# Altium schematic sheet Phase Current_Voltage Sense.SchDoc: =DT_SCH_Title
size A3; Organization: Droid Technologies; SheetNumber: 10; SheetTotal: 15
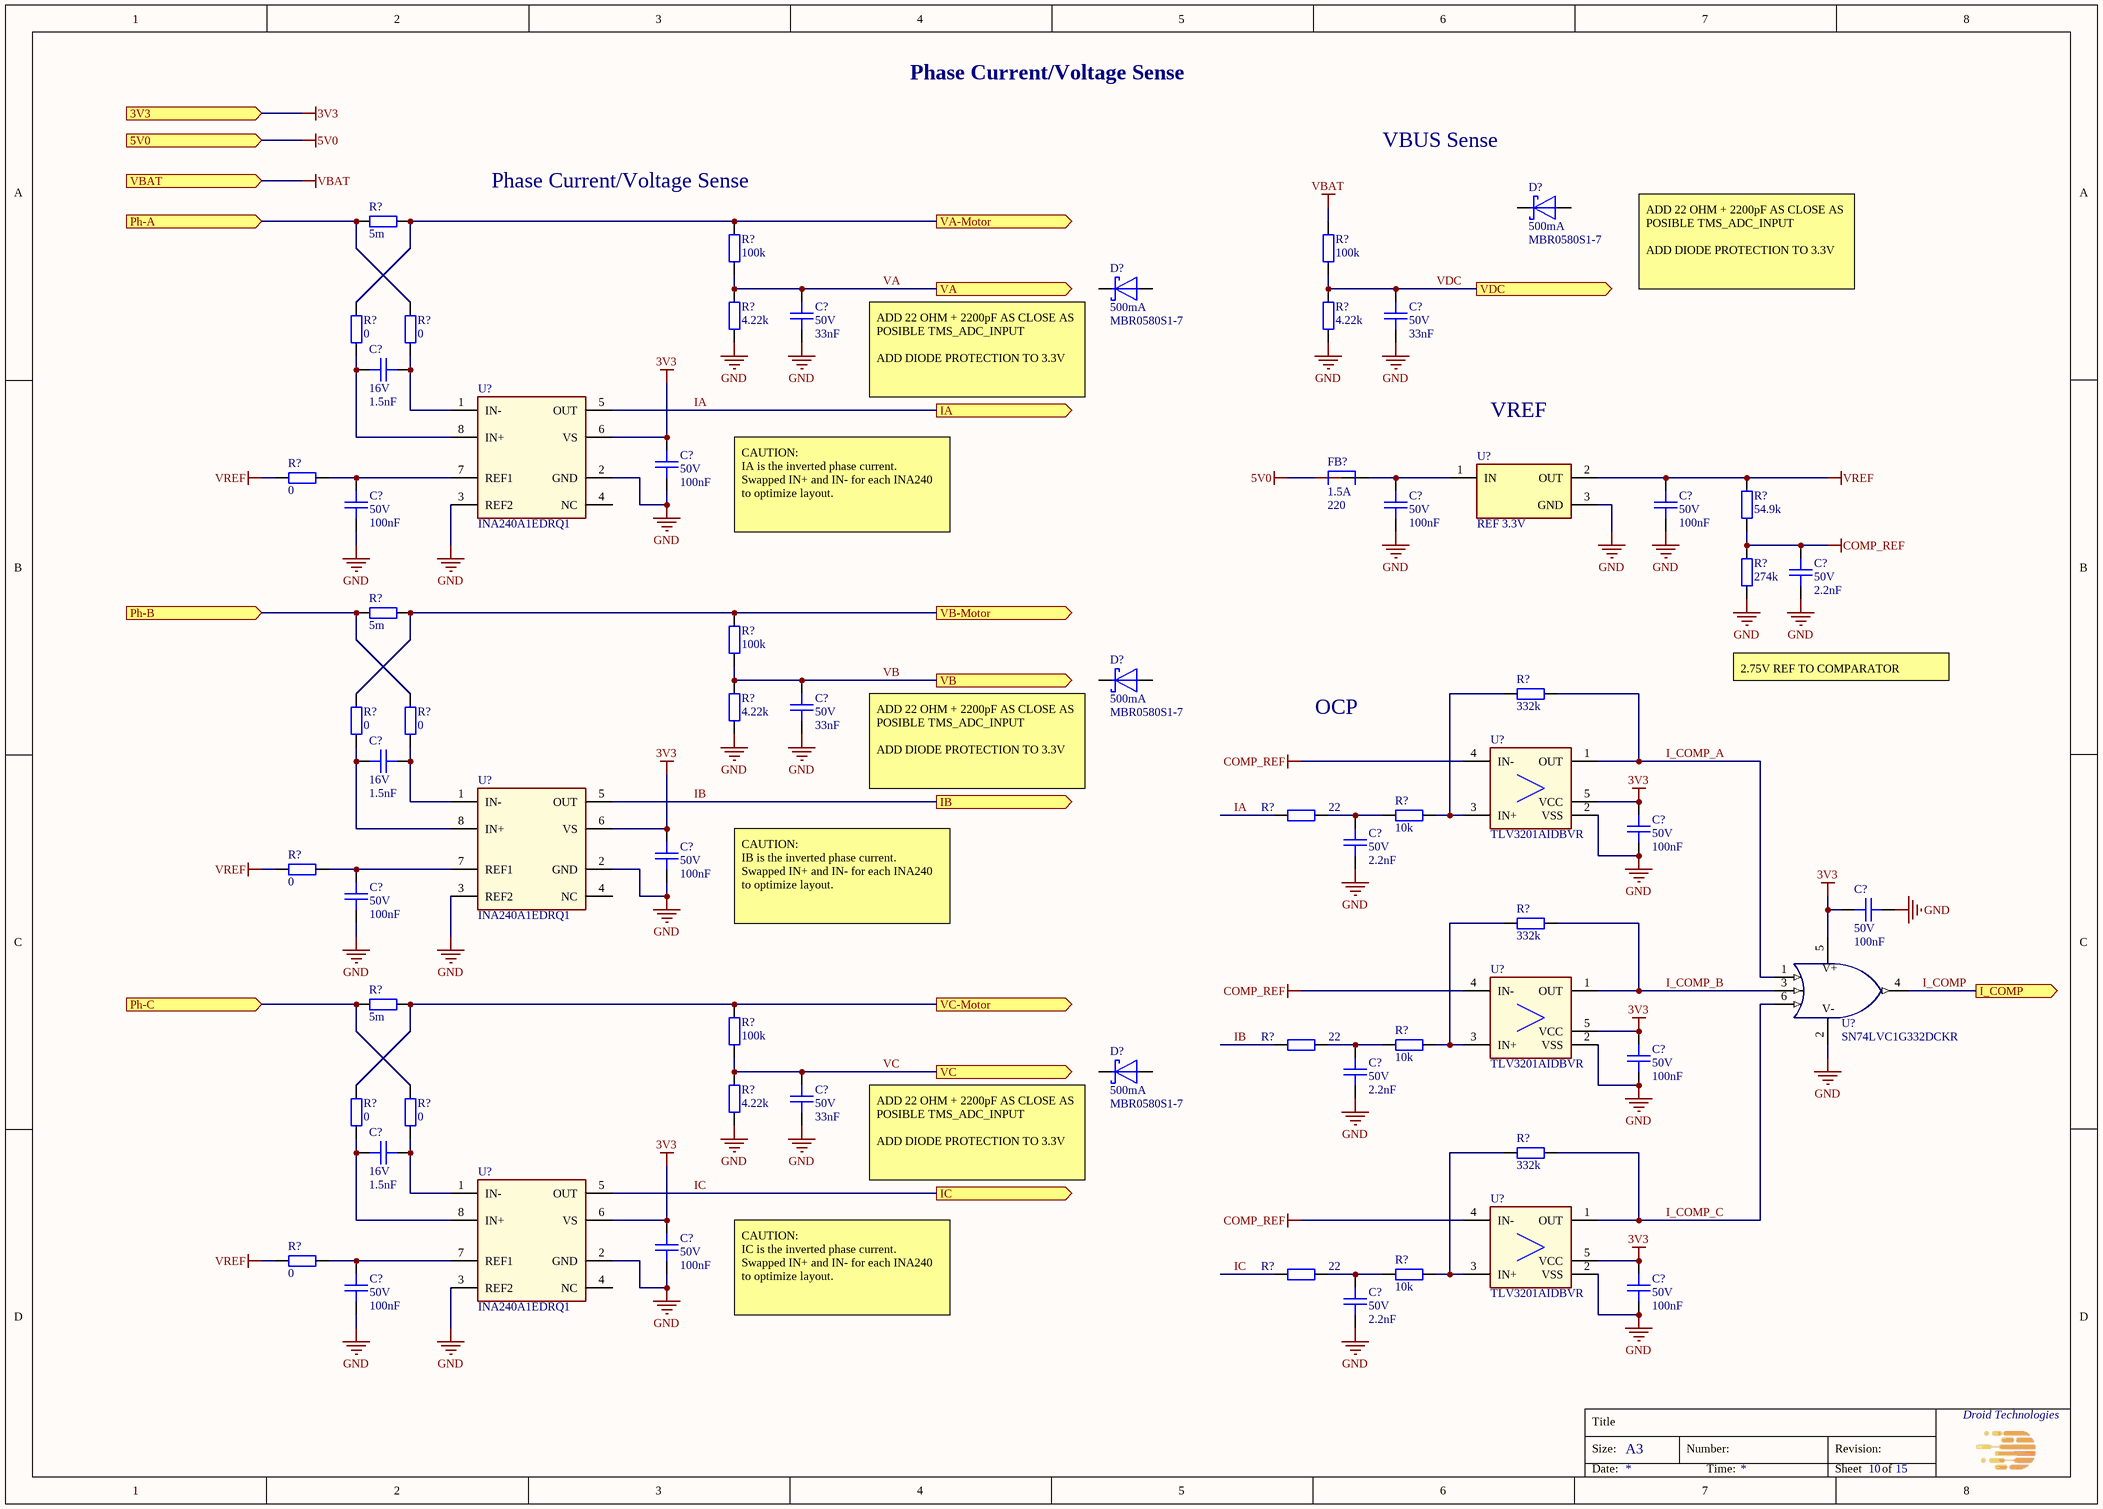
[diagram p0: Phase Current_Voltage Sense.SchDoc]

## Parts
(Parts that share a designator on the sheet are numbered #1, #2 ... from top to bottom, then left to right.)
C?#1  Voltage Rating: 50V  Capacitance: 33nF  [CAPC100x50x50L25]  (hidden comment: GCM155L8EH333KE07D)
C?#2  Voltage Rating: 50V  Capacitance: 33nF  [CAPC100x50x50L25]  (hidden comment: GCM155L8EH333KE07D)
C?#3  Voltage Rating: 16V  Capacitance: 1.5nF  [CAPC100x50x50L25]  (hidden comment: C0402C152F4HACAUTO)
C?#4  Voltage Rating: 50V  Capacitance: 100nF  [CAPC100x50x50L25]  (hidden comment: GCM155L8EH104KE07D)
C?#5  Voltage Rating: 50V  Capacitance: 100nF  [CAPC100x50x50L25]  (hidden comment: GCM155L8EH104KE07D)
C?#6  Voltage Rating: 50V  Capacitance: 100nF  [CAPC100x50x50L25]  (hidden comment: GCM155L8EH104KE07D)
C?#7  Voltage Rating: 50V  Capacitance: 100nF  [CAPC100x50x50L25]  (hidden comment: GCM155L8EH104KE07D)
C?#8  Voltage Rating: 50V  Capacitance: 2.2nF  [CAPC100x50x50L25]  (hidden comment: CGA2B2X8R1H222K050BA)
C?#9  Voltage Rating: 50V  Capacitance: 33nF  [CAPC100x50x50L25]  (hidden comment: GCM155L8EH333KE07D)
C?#10  Voltage Rating: 16V  Capacitance: 1.5nF  [CAPC100x50x50L25]  (hidden comment: C0402C152F4HACAUTO)
C?#11  Voltage Rating: 50V  Capacitance: 100nF  [CAPC100x50x50L25]  (hidden comment: GCM155L8EH104KE07D)
C?#12  Voltage Rating: 50V  Capacitance: 2.2nF  [CAPC100x50x50L25]  (hidden comment: CGA2B2X8R1H222K050BA)
C?#13  Voltage Rating: 50V  Capacitance: 100nF  [CAPC100x50x50L25]  (hidden comment: GCM155L8EH104KE07D)
C?#14  Voltage Rating: 50V  Capacitance: 100nF  [CAPC100x50x50L25]  (hidden comment: GCM155L8EH104KE07D)
C?#15  Voltage Rating: 50V  Capacitance: 100nF  [CAPC100x50x50L25]  (hidden comment: GCM155L8EH104KE07D)
C?#16  Voltage Rating: 50V  Capacitance: 100nF  [CAPC100x50x50L25]  (hidden comment: GCM155L8EH104KE07D)
C?#17  Voltage Rating: 50V  Capacitance: 2.2nF  [CAPC100x50x50L25]  (hidden comment: CGA2B2X8R1H222K050BA)
C?#18  Voltage Rating: 50V  Capacitance: 33nF  [CAPC100x50x50L25]  (hidden comment: GCM155L8EH333KE07D)
C?#19  Voltage Rating: 16V  Capacitance: 1.5nF  [CAPC100x50x50L25]  (hidden comment: C0402C152F4HACAUTO)
C?#20  Voltage Rating: 50V  Capacitance: 100nF  [CAPC100x50x50L25]  (hidden comment: GCM155L8EH104KE07D)
C?#21  Voltage Rating: 50V  Capacitance: 100nF  [CAPC100x50x50L25]  (hidden comment: GCM155L8EH104KE07D)
C?#22  Voltage Rating: 50V  Capacitance: 100nF  [CAPC100x50x50L25]  (hidden comment: GCM155L8EH104KE07D)
C?#23  Voltage Rating: 50V  Capacitance: 2.2nF  [CAPC100x50x50L25]  (hidden comment: CGA2B2X8R1H222K050BA)
D?#1  Current - Average Rectified (Io): 500mA  [SOD365X155X135L30X57]  (hidden comment: MBR0580S1-7)
D?#2  Current - Average Rectified (Io): 500mA  [SOD365X155X135L30X57]  (hidden comment: MBR0580S1-7)
D?#3  Current - Average Rectified (Io): 500mA  [SOD365X155X135L30X57]  (hidden comment: MBR0580S1-7)
D?#4  Current - Average Rectified (Io): 500mA  [SOD365X155X135L30X57]  (hidden comment: MBR0580S1-7)
FB?  Imax: 1.5A  Impedance: 220  [BEADC160X80X95L40]  (hidden comment: BLM18KG221BH1D)
R?#1  Resistance: 5m  [RESC640X320X80L95]  (hidden comment: CRE2512-FZ-R005E-3)
R?#2  Resistance: 100k  [RESC100X50X40L25]  (hidden comment: RC0402FR-07100KL)
R?#3  Resistance: 100k  [RESC100X50X40L25]  (hidden comment: RC0402FR-07100KL)
R?#4  Resistance: 4.22k  [RESC100X50X40L25]  (hidden comment: RC0402FR-074K22L)
R?#5  Resistance: 4.22k  [RESC100X50X40L25]  (hidden comment: RC0402FR-074K22L)
R?#6  Resistance: 0  [RESC160X80X55L30]  (hidden comment: RC0603FR-070RL)
R?#7  Resistance: 0  [RESC160X80X55L30]  (hidden comment: RC0603FR-070RL)
R?#8  Resistance: 0  [RESC160X80X55L30]  (hidden comment: RC0603FR-070RL)
R?#9  Resistance: 54.9k  [RESC100X50X40L25]  (hidden comment: RC0402FR-0754K9L)
R?#10  Resistance: 274k  [RESC100X50X40L25]  (hidden comment: RC0402FR-07274KL)
R?#11  Resistance: 5m  [RESC640X320X80L95]  (hidden comment: CRE2512-FZ-R005E-3)
R?#12  Resistance: 100k  [RESC100X50X40L25]  (hidden comment: RC0402FR-07100KL)
R?#13  Resistance: 332k  [RESC100X50X40L25]  (hidden comment: RC0402FR-07332KL)
R?#14  Resistance: 4.22k  [RESC100X50X40L25]  (hidden comment: RC0402FR-074K22L)
R?#15  Resistance: 0  [RESC160X80X55L30]  (hidden comment: RC0603FR-070RL)
R?#16  Resistance: 0  [RESC160X80X55L30]  (hidden comment: RC0603FR-070RL)
R?#17  Resistance: 22  [RESC100X50X40L25]  (hidden comment: RC0402FR-0722RL)
R?#18  Resistance: 10k  [RESC100X50X40L25]  (hidden comment: RC0402FR-0710KL)
R?#19  Resistance: 0  [RESC160X80X55L30]  (hidden comment: RC0603FR-070RL)
R?#20  Resistance: 332k  [RESC100X50X40L25]  (hidden comment: RC0402FR-07332KL)
R?#21  Resistance: 5m  [RESC640X320X80L95]  (hidden comment: CRE2512-FZ-R005E-3)
R?#22  Resistance: 22  [RESC100X50X40L25]  (hidden comment: RC0402FR-0722RL)
R?#23  Resistance: 10k  [RESC100X50X40L25]  (hidden comment: RC0402FR-0710KL)
R?#24  Resistance: 100k  [RESC100X50X40L25]  (hidden comment: RC0402FR-07100KL)
R?#25  Resistance: 4.22k  [RESC100X50X40L25]  (hidden comment: RC0402FR-074K22L)
R?#26  Resistance: 0  [RESC160X80X55L30]  (hidden comment: RC0603FR-070RL)
R?#27  Resistance: 0  [RESC160X80X55L30]  (hidden comment: RC0603FR-070RL)
R?#28  Resistance: 332k  [RESC100X50X40L25]  (hidden comment: RC0402FR-07332KL)
R?#29  Resistance: 0  [RESC160X80X55L30]  (hidden comment: RC0603FR-070RL)
R?#30  Resistance: 22  [RESC100X50X40L25]  (hidden comment: RC0402FR-0722RL)
R?#31  Resistance: 10k  [RESC100X50X40L25]  (hidden comment: RC0402FR-0710KL)
U?#1  INA240A1EDRQ1  [SOIC8P127_490X600X175L70X41]
U?#2  REF 3.3V  [SOT-23]
U?#3  TLV3201AIDBVR  [SOP5P95_290X280X145L45X40]
U?#4  INA240A1EDRQ1  [SOIC8P127_490X600X175L70X41]
U?#5  SN74LVC1G332DCKR  [SC70-6]
U?#6  TLV3201AIDBVR  [SOP5P95_290X280X145L45X40]
U?#7  INA240A1EDRQ1  [SOIC8P127_490X600X175L70X41]
U?#8  TLV3201AIDBVR  [SOP5P95_290X280X145L45X40]

## Ports
3V3 (in), 5V0 (in), I_COMP (out), IA (out), IB (out), IC (out), Ph-A (in), Ph-B (in), Ph-C (in), VA (out), VA-Motor (out), VB (out), VB-Motor (out), VBAT (in), VC (out), VC-Motor (out), VDC (out)

## Nets
3V3: C?#4.2 C?#11.2 C?#13.2 C?#14.2 C?#16.2 C?#20.2 C?#22.2 U?#1.6(VS) U?#3.5(VCC) U?#4.6(VS) U?#5.5(VCC) U?#6.5(VCC) U?#7.6(VS) U?#8.5(VCC) ; port 3V3
5V0: FB?.1 ; port 5V0
COMP_REF: C?#8.2 R?#9.1 R?#10.2 U?#3.4(IN-) U?#6.4(IN-) U?#8.4(IN-)
GND: C?#1.1 C?#2.1 C?#4.1 C?#5.1 C?#6.1 C?#7.1 C?#8.1 C?#9.1 C?#11.1 C?#12.1 C?#13.1 C?#14.1 C?#15.1 C?#16.1 C?#17.1 C?#18.1 C?#20.1 C?#21.1 C?#22.1 C?#23.1 R?#4.1 R?#5.1 R?#10.1 R?#14.1 R?#25.1 U?#1.2(GND) U?#1.3(REF2) U?#2.3(GND) U?#3.2(VSS) U?#4.2(GND) U?#4.3(REF2) U?#5.2(GND) U?#6.2(VSS) U?#7.2(GND) U?#7.3(REF2) U?#8.2(VSS)
VBAT: R?#3.2 ; port VBAT
VREF: C?#7.2 R?#8.1 R?#9.2 R?#19.1 R?#29.1 U?#2.2(OUT)
I_COMP: U?#5.4(Y) ; port I_COMP
I_COMP_A: R?#13.2 U?#3.1(OUT) U?#5.1(A)
I_COMP_B: R?#20.2 U?#5.3(B) U?#6.1(OUT)
I_COMP_C: R?#28.2 U?#5.6(C) U?#8.1(OUT)
IA: R?#17.1 U?#1.5(OUT) ; port IA
IB: R?#22.1 U?#4.5(OUT) ; port IB
IC: R?#30.1 U?#7.5(OUT) ; port IC
Ph-A: R?#1.1 R?#7.2 ; port Ph-A
Ph-B: R?#11.1 R?#16.2 ; port Ph-B
Ph-C: R?#21.1 R?#27.2 ; port Ph-C
VA: C?#1.2 R?#2.1 R?#4.2 ; port VA
VA-Motor: R?#1.2 R?#2.2 R?#6.2 ; port VA-Motor
VB: C?#9.2 R?#12.1 R?#14.2 ; port VB
VB-Motor: R?#11.2 R?#12.2 R?#15.2 ; port VB-Motor
VC: C?#18.2 R?#24.1 R?#25.2 ; port VC
VC-Motor: R?#21.2 R?#24.2 R?#26.2 ; port VC-Motor
VDC: C?#2.2 R?#3.1 R?#5.2 ; port VDC
NetC?#3_1: C?#3.1 R?#7.1 U?#1.1(IN-)
NetC?#3_2: C?#3.2 R?#6.1 U?#1.8(IN+)
NetC?#5_2: C?#5.2 R?#8.2 U?#1.7(REF1)
NetC?#6_2: C?#6.2 FB?.2 U?#2.1(IN)
NetC?#10_1: C?#10.1 R?#16.1 U?#4.1(IN-)
NetC?#10_2: C?#10.2 R?#15.1 U?#4.8(IN+)
NetC?#12_2: C?#12.2 R?#17.2 R?#18.1
NetC?#15_2: C?#15.2 R?#19.2 U?#4.7(REF1)
NetC?#17_2: C?#17.2 R?#22.2 R?#23.1
NetC?#19_1: C?#19.1 R?#27.1 U?#7.1(IN-)
NetC?#19_2: C?#19.2 R?#26.1 U?#7.8(IN+)
NetC?#21_2: C?#21.2 R?#29.2 U?#7.7(REF1)
NetC?#23_2: C?#23.2 R?#30.2 R?#31.1
NetR?#13_1: R?#13.1 R?#18.2 U?#3.3(IN+)
NetR?#20_1: R?#20.1 R?#23.2 U?#6.3(IN+)
NetR?#28_1: R?#28.1 R?#31.2 U?#8.3(IN+)

Not connected (* = marked no-connect by the designer): D?#1 1 2; D?#2 1 2; D?#3 1 2; D?#4 1 2; U?#1 4(NC); U?#4 4(NC); U?#7 4(NC)

## Notes on the sheet
- Phase Current/Voltage Sense
- VBUS Sense
- (near R?#2) Phase Current/Voltage Sense
- ADD 22 OHM + 2200pF AS CLOSE AS POSIBLE TMS_ADC_INPUT
  ADD DIODE PROTECTION TO 3.3V
- (near D?#2) ADD 22 OHM + 2200pF AS CLOSE AS POSIBLE TMS_ADC_INPUT
  ADD DIODE PROTECTION TO 3.3V
- VREF
- CAUTION:
  IA is the inverted phase current.
  Swapped IN+ and IN- for each INA240 to optimize layout.
- OCP
- 2.75V REF TO COMPARATOR
- (near D?#3) ADD 22 OHM + 2200pF AS CLOSE AS POSIBLE TMS_ADC_INPUT
  ADD DIODE PROTECTION TO 3.3V
- CAUTION:
  IB is the inverted phase current.
  Swapped IN+ and IN- for each INA240 to optimize layout.
- (near D?#4) ADD 22 OHM + 2200pF AS CLOSE AS POSIBLE TMS_ADC_INPUT
  ADD DIODE PROTECTION TO 3.3V
- CAUTION:
  IC is the inverted phase current.
  Swapped IN+ and IN- for each INA240 to optimize layout.
- Title
- Size:
- A3
- Number:
- Revision:
- Date:
- Time:
- Sheet
- of
- (in symbol SN74LVC1G332DCKR) V+; V-

## Library data of the parts
C?#1 C?#2 C?#9 C?#18 = CMP-001-2007-1: CAP CER 0.033UF 50V X8L 0402; Manufacturer: Murata Electronics; Op Temp max: 150°C; Tolerance: 10%; Op Temp min: -55°C; ComponentLink1URL: https://search.murata.co.jp/Ceramy/image/img/A01X/G101/ENG/GCM155L8EH333KE07-01A.pdf; Mounting Type: SM; Dielectric: X8L; ComponentLink3URL: https://www.digikey.com/en/products/detail/murata-electronics/GCM155L8EH333KE07D/17845188; Size: 1.00mm x 0.50mm; ComponentLink1Description: Datasheet; ComponentLink3Description: Digikey; Package: 0402 (1005 Metric); MPN: GCM155L8EH333KE07D; ComponentLink2Description: Mouser; Height max: 550µm; Lead Spacing: 0mm; ComponentLink2URL: https://eu.mouser.com/ProductDetail/Murata-Electronics/GCM155L8EH333KE07D?qs=rrS6PyfT74cZK6FfR7MiFw%3D%3D; Ratings: AEC-Q200
C?#3 C?#10 C?#19 = CMP-001-2006-1: CAP CER 0402 1.5NF 16V ULTRA STA; Manufacturer: KEMET; Op Temp min: -55°C; Op Temp max: 150°C; Dielectric: X8R; Tolerance: 1%; Ratings: AEC-Q200; Lead Spacing: 0mm; Package: 0402 (1005 Metric); Size: 1.00mm x 0.50mm; ComponentLink3URL: https://www.digikey.com/en/products/detail/kemet/C0402C152F4HACAUTO/7955197?s=N4IgjCBcpgLFoDGUBmBDANgZwKYBoQB7KAbXAAYAOAdlgCYQBdAgBwBcoQBlNgJwEsAdgHMQAXwJgAbAhDJI6bPiKkQAZgCcYAKyUmrDpG58hoiSDraG0Oaky4CxSGTr0NaiMxDtOPASPECanJqWXlFBxVndTA6MHJtfW9DY38zSQ1KDTC7JUdVciZzOnJYbJtw%2B2UnMh1ycgACFgAxJJ8jAFVBfjYAeRQAWRw0LABXXhxAkABaayQoPlHq1UTGMWLVOvIWFCKgA; ComponentLink2Description: Mouser; ComponentLink3Description: Digikey; ComponentLink1URL: https://content.kemet.com/datasheets/KEM_C1007_X8R_ULTRA_150C_SMD.pdf; Mounting Type: SM; MPN: C0402C152F4HACAUTO; Height max: 550µm; ComponentLink1Description: Datasheet; ComponentLink2URL: https://eu.mouser.com/ProductDetail/KEMET/C0402C152F4HACAUTO?qs=j%252B1pi9TdxUbEW1hCqLU6QA%3D%3D
C?#4-C?#7 C?#11 C?#13-C?#16 C?#20-C?#22 = CMP-001-1980-1: CAP CER 0.1UF 50V X8L 0402; Manufacturer: Murata Electronics; Op Temp max: 150°C; Op Temp min: -55°C; Tolerance: 10%; Height max: 550µm; ComponentLink3Description: Digikey; Mounting Type: SM; ComponentLink3URL: https://www.digikey.com/en/products/detail/murata-electronics/GCM155L8EH104KE07D/11618823; Package: 0402 (1005 Metric); Lead Spacing: 0mm; MPN: GCM155L8EH104KE07D; Size: 1.00mm x 0.50mm; Ratings: AEC-Q200; ComponentLink1URL: https://search.murata.co.jp/Ceramy/image/img/A01X/G101/ENG/GCM155L8EH104KE07-01.pdf; ComponentLink1Description: Datasheet; Dielectric: X8L; ComponentLink2Description: Mouser; ComponentLink2URL: https://eu.mouser.com/ProductDetail/Murata-Electronics/GCM155L8EH104KE07D?qs=1mbolxNpo8fQSHf0HYnZWw%3D%3D
C?#8 C?#12 C?#17 C?#23 = CMP-001-2008-1: CAP CER 2200PF 50V X8R 0402; Manufacturer: TDK Corporation; Op Temp max: 150°C; Op Temp min: -55°C; Tolerance: 10%; Size: 1.00mm x 0.50mm; ComponentLink1URL: https://product.tdk.com/system/files/dam/doc/product/capacitor/ceramic/mlcc/catalog/mlcc_automotive_hightemp_en.pdf; ComponentLink3Description: Digikey; Mounting Type: SM; Ratings: AEC-Q200; ComponentLink3URL: https://www.digikey.com/en/products/detail/tdk-corporation/CGA2B2X8R1H222K050BA/2443359; Dielectric: X8R; ComponentLink2URL: https://eu.mouser.com/ProductDetail/TDK/CGA2B2X8R1H222K050BA?qs=NRhsANhppD9e0pyGSMWEuA%3D%3D; Height max: 550µm; ComponentLink1Description: Datasheet; Package: 0402 (1005 Metric); ComponentLink2Description: Mouser; MPN: CGA2B2X8R1H222K050BA; Lead Spacing: 0mm
D?#1-D?#4 = CMP-001-0960-4: DIODE SCHOTTKY 80V 500MA SOD123; Manufacturer: Diodes Incorporated; Voltage - Forward (Vf) (Max) @ If: 800 mV @ 500 mA; Op Temp max: 175°C; Capacitance: 15pF; Op Temp min: -55°C; Reverse Recovery Time (trr): 0s; Diode Type: Schottky; ComponentLink2URL: https://eu.mouser.com/ProductDetail/Diodes-Incorporated/MBR0580S1-7?qs=jXf%2FRVhl83bQOuXZ5W6icQ%3D%3D; Mounting Type: SM; ComponentLink1Description: Datasheet; MPN: MBR0580S1-7; ComponentLink1URL: https://mm.digikey.com/Volume0/opasdata/d220001/medias/docus/2174/MBR0580S1_R5.pdf; ComponentLink3URL: https://www.digikey.com/en/products/detail/diodes-incorporated/MBR0580S1-7/5080335; Size: 3.65mm x 1.55mm; Voltage - DC Reverse (Vr) (Max): 80V; ComponentLink3Description: Digikey; Package: SOD-123; Height max: 1.35mm; ComponentLink2Description: Mouser
FB? = CMP-001-1981-1: FERRITE BEAD 220 OHM 0603 1LN; Manufacturer: Murata Electronics; DCR: 50m; Op Temp min: -55°C; Frequency: 100MHz; Op Temp max: 150°C; Number of Lines: 1; Mounting Type: SM; Size: 1.60mm x 0.80mm; ComponentLink2URL: https://eu.mouser.com/ProductDetail/Murata-Electronics/BLM18KG221BH1D?qs=sJ5gq5MLFXpgEHYBdWUtkQ%3D%3D; ComponentLink1Description: Datasheet; ComponentLink1URL: https://www.murata.com/en-us/products/productdata/8798137286686/QNFA9129.pdf; Lead Spacing: 0mm; Ratings: AEC-Q200; ComponentLink3Description: Digikey; ComponentLink3URL: https://www.digikey.com/en/products/detail/murata-electronics/BLM18KG221BH1D/6156000; Height max: 950µm; Package: 0603 (1608 Metric); ComponentLink2Description: Mouser; MPN: BLM18KG221BH1D
R?#1 R?#11 R?#21 = CMP-001-0349-5: RES 0.005 OHM 1% 3W 2512; Manufacturer: Bourns Inc.; Op Temp max: 170°C; Temperature Coefficient: ±50ppm; Op Temp min: -55°C; Power: 3W; Composition: Metal Element; Height max: 900µm; Mounting Type: SM; Ratings: AEC-Q200; Package: 2512 (6432 Metric); ComponentLink3Description: Digikey; ComponentLink3URL: https://www.digikey.com/en/products/detail/bourns-inc/CRE2512-FZ-R005E-3/4900061?s=N4IgTCBcDaIMICUCiYCsBGMBaAYgLSwQAYjUksBmEAXQF8g; ComponentLink2Description: Mouser; MPN: CRE2512-FZ-R005E-3; ComponentLink2URL: https://eu.mouser.com/ProductDetail/Bourns/CRE2512-FZ-R005E-3?qs=rpfKl3ntHzNlYrjx6b2oeg%3D%3D; ComponentLink1Description: Datasheet; ComponentLink1URL: https://www.bourns.com/docs/product-datasheets/cre.pdf; Size: 6.45mm x 3.35mm; Tolerance: 1%
R?#2 R?#3 R?#12 R?#24 = CMP-00121-6: RES 100K OHM 1% 1/16W 0402; Manufacturer: YAGEO; Op Temp min: -55°C; Op Temp max: 155°C; Power: 63mW; Temperature Coefficient: ±100ppm; ComponentLink2Description: Mouser; Mounting Type: SM; Composition: Thick Film; ComponentLink3URL: https://www.digikey.com/en/products/detail/yageo/RC0402FR-07100KL/726526; Size: 1.00mm x 0.50mm; MPN: RC0402FR-07100KL; Tolerance: 1%; Ratings: -; ComponentLink1Description: Datasheet; ComponentLink2URL: https://eu.mouser.com/ProductDetail/YAGEO/RC0402FR-07100KL?qs=%2Fha2pyFaduhjtLcYvKXQ8IUndG0u%252BuCx1gxMxvN%252Btd7iB7mgHWsSbw%3D%3D; Package: 0402 (1005 Metric); ComponentLink1URL: https://www.yageo.com/upload/media/product/productsearch/datasheet/rchip/PYu-RC_Group_51_RoHS_L_12.pdf; ComponentLink3Description: Digikey; Height max: 400µm
R?#4 R?#5 R?#14 R?#25 = CMP-00686-2: RES 4.22K OHM 1% 1/16W 0402; Manufacturer: YAGEO; Temperature Coefficient: ±100ppm; Op Temp max: 155°C; Op Temp min: -55°C; Power: 63mW; Height max: 400µm; Tolerance: 1%; Mounting Type: SM; ComponentLink2URL: https://eu.mouser.com/ProductDetail/YAGEO/RC0402FR-074K22L?qs=UOUeRUa%252B8WlIkeLfnYGqDQ%3D%3D; ComponentLink3URL: https://www.digikey.com/en/products/detail/yageo/RC0402FR-074K22L/5281032?s=N4IgTCBcDaIEoGEAMAWJYBicC0SDsKA0mGADIgC6AvkA; ComponentLink2Description: Mouser; Package: 0402 (1005 Metric); ComponentLink3Description: Digikey; MPN: RC0402FR-074K22L; Ratings: -; ComponentLink1Description: Datasheet; ComponentLink1URL: https://www.yageo.com/upload/media/product/productsearch/datasheet/rchip/PYu-RC_Group_51_RoHS_L_12.pdf; Composition: Thick Film; Size: 1.00mm x 0.50mm
R?#6-R?#8 R?#15 R?#16 R?#19 R?#26 R?#27 R?#29 = CMP-001-0927-2: RES 0 OHM JUMPER 1/10W 0603; Manufacturer: YAGEO; Op Temp min: -55°C; Op Temp max: 155°C; Power: 100mW; Tolerance: 0%; Height max: 550µm; ComponentLink2URL: https://eu.mouser.com/ProductDetail/YAGEO/RC0603FR-070RL?qs=0yPvnVz5%2FmpDQv43TwvCfw%3D%3D; Temperature Coefficient: -; ComponentLink3Description: Digikey; ComponentLink2Description: Mouser; MPN: RC0603FR-070RL; ComponentLink1URL: https://www.yageo.com/upload/media/product/productsearch/datasheet/rchip/PYu-RC_Group_51_RoHS_L_12.pdf; Ratings: -; Size: 1.60mm x 0.80mm; Composition: Thick Film; Mounting Type: SM; ComponentLink3URL: https://www.digikey.com/en/products/detail/yageo/RC0603FR-070RL/1304008; Package: 0603 (1608 Metric); ComponentLink1Description: Datasheet
R?#9 = CMP-001-1595-1: RES 54.9K OHM 1% 1/16W 0402; Manufacturer: YAGEO; Op Temp max: 155°C; Power: 63mW; Op Temp min: -55°C; Temperature Coefficient: ±100ppm; Size: 1.00mm x 0.50mm; Composition: Thick Film; Ratings: -; ComponentLink1Description: Datasheet; Tolerance: 1%; ComponentLink2URL: https://eu.mouser.com/ProductDetail/YAGEO/RC0402FR-0754K9L?qs=4PGqJHn8QVJggq6NOjvQiQ%3D%3D; Package: 0402 (1005 Metric); ComponentLink3URL: https://www.digikey.com/en/products/detail/yageo/RC0402FR-0754K9L/5281045; Mounting Type: SM; MPN: RC0402FR-0754K9L; ComponentLink3Description: Digikey; ComponentLink2Description: Mouser; Height max: 400µm; ComponentLink1URL: https://www.yageo.com/upload/media/product/products/datasheet/rchip/PYu-RC_Group_51_RoHS_L_12.pdf
R?#10 = CMP-00590-3: RES 274K OHM 1% 1/16W 0402; Manufacturer: YAGEO; Op Temp min: -55°C; Op Temp max: 155°C; Temperature Coefficient: ±100ppm; Power: 63mW; MPN: RC0402FR-07274KL; ComponentLink3Description: Digikey; Ratings: -; ComponentLink2Description: Mouser; ComponentLink1URL: https://www.yageo.com/upload/media/product/productsearch/datasheet/rchip/PYu-RC_Group_51_RoHS_L_12.pdf; Size: 1.00mm x 0.50mm; ComponentLink1Description: Datasheet; Tolerance: 1%; Height max: 400µm; Package: 0402 (1005 Metric); Composition: Thick Film; ComponentLink3URL: https://www.digikey.com/en/products/detail/yageo/RC0402FR-07274KL/5280943?s=N4IgTCBcDaIEoGEAMAWJYBicC0SDsYeKA0gDIgC6AvkA; Mounting Type: SM; ComponentLink2URL: https://eu.mouser.com/ProductDetail/YAGEO/RC0402FR-07274KL?qs=UOUeRUa%252B8WkXvujgT9w63w%3D%3D
R?#13 R?#20 R?#28 = CMP-00670-2: RES 332K OHM 1% 1/16W 0402; Manufacturer: YAGEO; Op Temp max: 155°C; Temperature Coefficient: ±100ppm; Power: 63mW; Op Temp min: -55°C; Size: 1.00mm x 0.50mm; ComponentLink1Description: Datasheet; Composition: Thick Film; Package: 0402 (1005 Metric); Height max: 400µm; Ratings: -; ComponentLink2Description: Mouser; ComponentLink3Description: Digikey; MPN: RC0402FR-07332KL; ComponentLink1URL: https://www.yageo.com/upload/media/product/productsearch/datasheet/rchip/PYu-RC_Group_51_RoHS_L_12.pdf; ComponentLink2URL: https://eu.mouser.com/ProductDetail/YAGEO/RC0402FR-07332KL?qs=5YWhraou11DzMN0bHRRHtQ%3D%3D; ComponentLink3URL: https://www.digikey.com/en/products/detail/yageo/RC0402FR-07332KL/726595?s=N4IgTCBcDaIEoGEAMAWJYBicC0SDsAzAWANIAyIAugL5A; Mounting Type: SM; Tolerance: 1%
R?#17 R?#22 R?#30 = CMP-001-0482-4: RES 22 OHM 1% 1/16W 0402; Manufacturer: YAGEO; Temperature Coefficient: ±100ppm; Op Temp max: 155°C; Op Temp min: -55°C; Power: 63mW; Ratings: -; ComponentLink3URL: https://www.digikey.com/en/products/detail/yageo/RC0402FR-0722RL/726562; ComponentLink2URL: https://eu.mouser.com/ProductDetail/YAGEO/RC0402FR-0722RL?qs=V1yeUXFNrkkRg6zf08ADKQ%3D%3D; MPN: RC0402FR-0722RL; ComponentLink1Description: Datasheet; ComponentLink3Description: Digikey; Tolerance: 1%; Size: 1.00mm x 0.50mm; ComponentLink1URL: https://www.yageo.com/upload/media/product/productsearch/datasheet/rchip/PYu-RC_Group_51_RoHS_L_12.pdf; Composition: Thick Film; ComponentLink2Description: Mouser; Mounting Type: SM; Package: 0402 (1005 Metric); Height max: 400µm
R?#18 R?#23 R?#31 = CMP-00010-6: RES 10K OHM 1% 1/16W 0402; Manufacturer: YAGEO; Op Temp max: 155°C; Op Temp min: -55°C; Power: 63mW; Temperature Coefficient: ±100ppm; ComponentLink3URL: https://www.digikey.com/en/products/detail/yageo/RC0402FR-0710KL/726523; ComponentLink1Description: Datasheet; Height max: 400µm; ComponentLink3Description: Digikey; ComponentLink2URL: https://www2.mouser.com/ProductDetail/YAGEO/RC0402FR-0710KL?qs=%2Fha2pyFaduhjtLcYvKXQ8NAGbRXkQ%2Fwl6RsvWHeV66MSeqLhkcF3rg%3D%3D; Ratings: -; MPN: RC0402FR-0710KL; ComponentLink1URL: https://www.yageo.com/upload/media/product/productsearch/datasheet/rchip/PYu-RC_Group_51_RoHS_L_12.pdf; ComponentLink2Description: Mouser; Mounting Type: SM; Tolerance: 1%; Composition: Thick Film; Size: 1.00mm x 0.50mm; Package: 0402 (1005 Metric)
U?#1 U?#4 U?#7 = INA240A1EDRQ1: IC CURRENT SENSE 1 CIRCUIT 8SOIC; Manufacturer: Texas Instruments; MPN: INA240A1EDRQ1
U?#2 = REF3333AIDBZR: IC VREF SERIES 0.15% SOT23-3; Manufacturer: Texas Instruments; MPN: REF3333AIDBZR
U?#3 U?#6 U?#8 = CMP-001-2009-1: IC COMPARATOR 1 GEN PUR SOT23-5; Manufacturer: Texas Instruments; Op Temp max: 125°C; Current - Quiescent (Max): 40µA; Output Type: Push-Pull; Propagation Delay (Max): 50ns; Number of Elements: 1; Op Temp min: -40°C; Hysteresis: 1.2mV; Current - Input Bias (Max): 0.005µA @ 5V; Voltage - Input Offset (Max): 1mV @ 5V; CMRR, PSRR (Typ): 70dB CMRR, 85dB PSRR; Current - Output (Typ): 21mA; Voltage - Supply, Single/Dual (±): 2.7V ~ 5.5V; ComponentLink1Description: Datasheet; ComponentLink1URL: https://www.ti.com/lit/ds/symlink/tlv3201.pdf?HQS=dis-dk-null-digikeymode-dsf-pf-null-wwe&ts=1745660417910&ref_url=https%253A%252F%252Fwww.ti.com%252Fgeneral%252Fdocs%252Fsuppproductinfo.tsp%253FdistId%253D10%2526gotoUrl%253Dhttps%253A%252F%252Fwww.ti.com%252Flit%252Fgpn%252Ftlv3201; ComponentLink2Description: Mouser; Mounting Type: SM; ComponentLink3URL: https://www.digikey.com/en/products/detail/texas-instruments/TLV3201AIDBVR/3188691?s=N4IgTCBcDaICoBkBqBmMAGAjAQQJIBEAhJAJRAF0BfIA; ComponentLink2URL: https://eu.mouser.com/ProductDetail/Texas-Instruments/TLV3201AIDBVR?qs=5771e39Rz9GGuYwPEKy7fA%3D%3D; ComponentLink3Description: Digikey; Package: SC-74A, SOT-753; Ratings: -; MPN: TLV3201AIDBVR
U?#5 = SN74LVC1G332DCKR: IC GATE OR 1CH 3-INP SC70-6; Manufacturer: Texas Instruments; MPN: SN74LVC1G332DCKR